# Altium schematic sheet AUDIO&ETHNET.SchDoc: Explorer STM32F407 Board
size A4; Author: ATOM@ALIENTEK; Revision: V3.4; SheetSize: A4
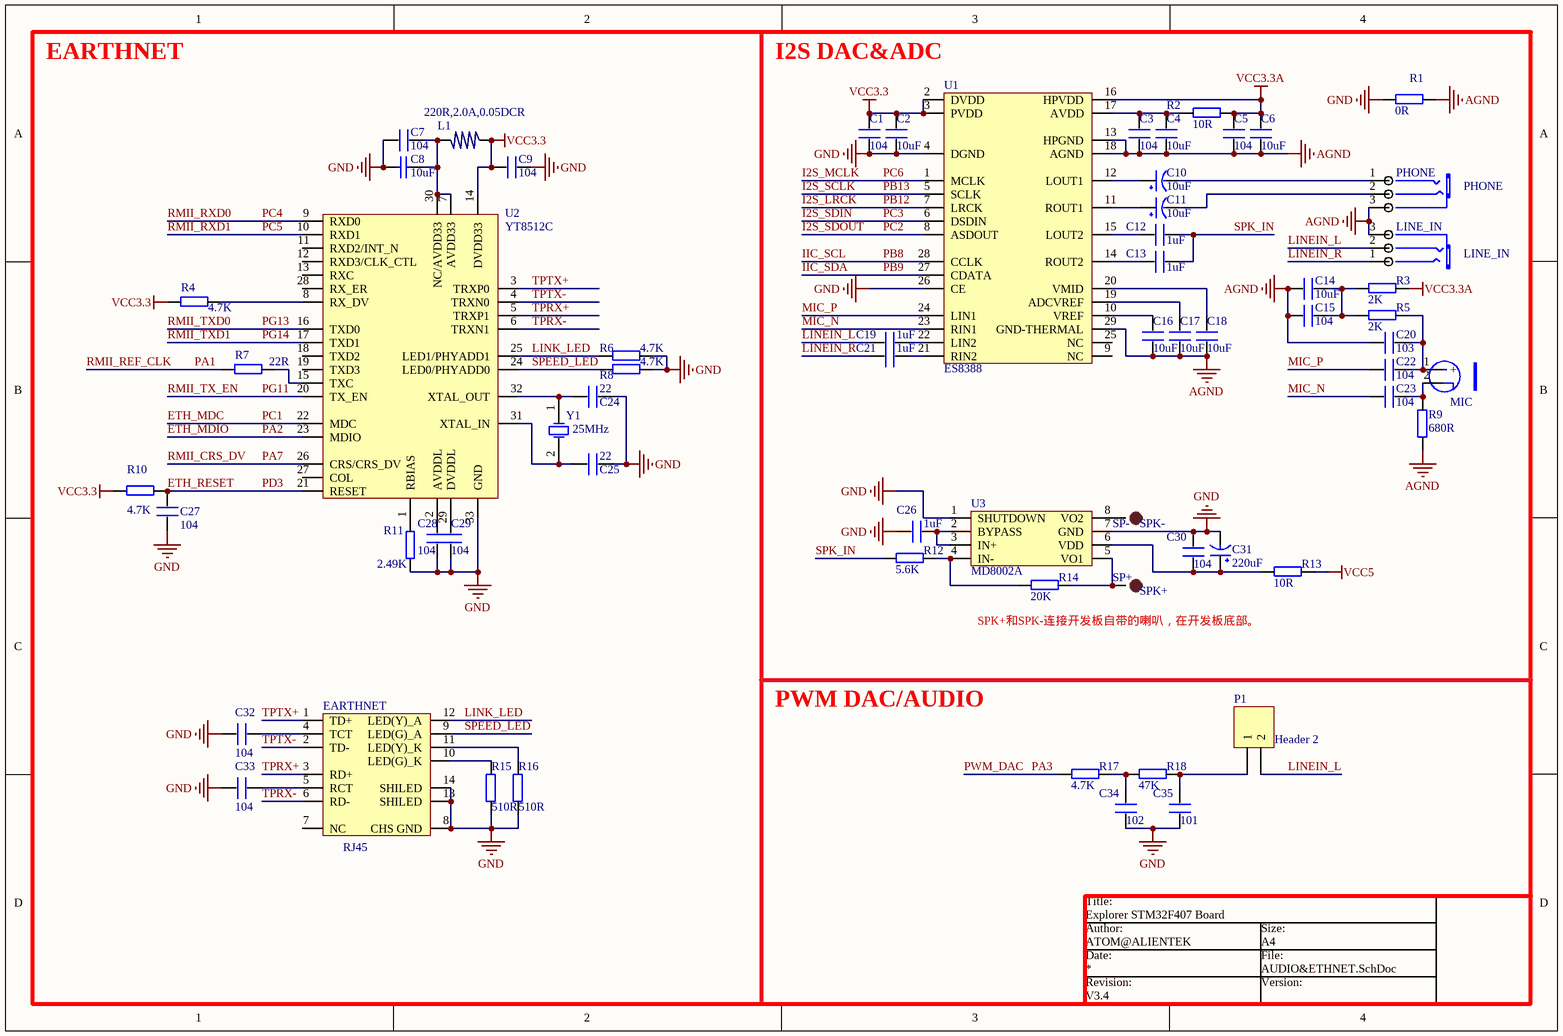
[diagram p0: AUDIO&ETHNET.SchDoc]

## Parts
C1  104  [0402]
C2  10uF  [0603P]
C3  104  [0402]
C4  10uF  [0603P]
C5  104  [0402]
C6  10uF  [0603P]
C7  104  [0402]
C8  10uF  [0603P]
C9  104  [0402]
C10  10uF  [0603P]
C11  10uF  [0603P]
C12  1uF  [0402]
C13  1uF  [0402]
C14  10uF  [0603P]
C15  104  [0402]
C16  10uF  [0603P]
C17  10uF  [0603P]
C18  10uF  [0603P]
C19  1uF  [0402]
C20  103  [0402]
C21  1uF  [0402]
C22  104  [0402]
C23  104  [0402]
C24  22  [0402]
C25  22  [0402]
C26  1uF  [0402]
C27  104  [0402]
C28  104  [0402]
C29  104  [0402]
C30  104  [0402]
C31  220uF  [CC6.56.5]
C32  104  [0402]
C33  104  [0402]
C34  102  [0402]
C35  101  [0402]
EARTHNET  RJ45  [HR911105A]
L1  220R,2.0A,0.05DCR  [0603P]
LINE_IN  LINE_IN  [PHONE_ST]
MIC1  MIC  [MIC-6022]
P1  Header 2  [HDR1X2]
PHONE  PHONE  [PHONE_ST]
R1  0R  [0402]
R2  10R  [0402]
R3  2K  [0402]
R4  4.7K  [0402]
R5  2K  [0402]
R6  4.7K  [0402]
R7  22R  [0402]
R8  4.7K  [0402]
R9  680R  [0402]
R10  4.7K  [0402]
R11  2.49K  [0402]
R12  5.6K  [0402]
R13  10R  [0402]
R14  20K  [0402]
R15  510R  [0402]
R16  510R  [0402]
R17  4.7K  [0402]
R18  47K  [0402]
SP+  SPK+  [TP-1.5]
SP-  SPK-  [TP-1.5]
U1  ES8388  [qfn28]
U2  YT8512C  [YT8512C]
U3  MD8002A  [SOP-8]
Y1  25MHz  [XTAL_US]

## Nets
AGND: C3.1 C4.1 C5.1 C6.1 C14.2 C15.1 C16.1 C17.1 C18.1 C20.2 LINE_IN.3(COM) PHONE.3(COM) R1.1 R9.2 U1.13(HPGND) U1.18(AGND) U1.29(GND-THERMAL)
GND: C1.1 C2.1 C7.1 C8.2 C9.1 C24.1 C25.1 C26.1 C27.1 C28.1 C29.1 C30.2 C31.2(GND) C32.1 C33.1 C34.1 C35.1 EARTHNET.8(CHS_GND) EARTHNET.13(SHILED) EARTHNET.14(SHILED) R1.2 R6.1 R8.1 R11.2 R15.2 R16.2 U1.4(DGND) U1.26(CE) U2.33(GND) U3.1(SHUTDOWN) U3.7(GND)
VCC3.3: C1.2 C2.2 C9.2 L1.1 R4.2 R10.2 U1.2(DVDD) U1.3(PVDD) U2.14(DVDD33)
VCC3.3A: C5.2 C6.2 R2.1 R3.1 U1.16(HPVDD)
VCC5: R13.1
ETH_MDC: U2.22(MDC)  [also labelled PC1]
ETH_MDIO: U2.23(MDIO)  [also labelled PA2]
ETH_RESET: C27.2 R10.1 U2.21(RESET)  [also labelled PD3]
I2S_LRCK: U1.7(LRCK)  [also labelled PB12]
I2S_MCLK: U1.1(MCLK)  [also labelled PC6]
I2S_SCLK: U1.5(SCLK)  [also labelled PB13]
I2S_SDIN: U1.6(DSDIN)  [also labelled PC3]
I2S_SDOUT: U1.8(ASDOUT)  [also labelled PC2]
IIC_SCL: U1.28(CCLK)  [also labelled PB8]
IIC_SDA: U1.27(CDATA)  [also labelled PB9]
LINEIN_L: C19.1 LINE_IN.2(CHR) P1.2
LINEIN_R: C21.1 LINE_IN.1(CHL)
LINK_LED: EARTHNET.12(LED(Y)_A) R6.2 U2.25(LED1/PHYADD1)
MIC_N: C23.2 U1.23(RIN1)
MIC_P: C22.2 U1.24(LIN1)
PA1: R7.2  [also labelled RMII_REF_CLK]
PA3: R17.2  [also labelled PWM_DAC]
PA7: U2.26(CRS/CRS_DV)  [also labelled RMII_CRS_DV]
PC4: U2.9(RXD0)  [also labelled RMII_RXD0]
PC5: U2.10(RXD1)  [also labelled RMII_RXD1]
PG11: U2.20(TX_EN)  [also labelled RMII_TX_EN]
PG13: U2.16(TXD0)  [also labelled RMII_TXD0]
PG14: U2.17(TXD1)  [also labelled RMII_TXD1]
SPEED_LED: EARTHNET.9(LED(G)_A) R8.2 U2.24(LED0/PHYADD0)
SPK_IN: C12.2 C13.2 R12.2
TPRX+: EARTHNET.3(RD+) U2.5(TRXP1)
TPRX-: EARTHNET.6(RD-) U2.6(TRXN1)
TPTX+: EARTHNET.1(TD+) U2.3(TRXP0)
TPTX-: EARTHNET.2(TD-) U2.4(TRXN0)
NetC3_2: C3.2 C4.2 R2.2 U1.17(AVDD)
NetC7_2: C7.2 C8.1 L1.2 U2.7(AVDD33) U2.30(NC/AVDD33)
NetC10_1: C10.1(VCC) U1.12(LOUT1)
NetC10_2: C10.2(GND) PHONE.1(CHL)
NetC11_1: C11.1(VCC) U1.11(ROUT1)
NetC11_2: C11.2(GND) PHONE.2(CHR)
NetC12_1: C12.1 U1.15(LOUT2)
NetC13_1: C13.1 U1.14(ROUT2)
NetC14_1: C14.1 C15.2 R3.2 R5.2
NetC16_2: C16.2 U1.10(VREF)
NetC17_2: C17.2 U1.19(ADCVREF)
NetC18_2: C18.2 U1.20(VMID)
NetC19_2: C19.2 U1.22(LIN2)
NetC20_1: C20.1 C22.1 MIC1.1(+) R5.1
NetC21_2: C21.2 U1.21(RIN2)
NetC23_1: C23.1 MIC1.2(GND) R9.1
NetC24_2: C24.2 U2.32(XTAL_OUT) Y1.1(OSC1)
NetC25_2: C25.2 U2.31(XTAL_IN) Y1.2(OSC2)
NetC26_2: C26.2 U3.2(BYPASS) U3.3(IN+)
NetC28_2: C28.2 U2.2(AVDDL)
NetC29_2: C29.2 U2.29(DVDDL)
NetC30_1: C30.1 C31.1(VCC) R13.2 U3.6(VDD)
NetC32_2: C32.2 EARTHNET.4(TCT)
NetC33_2: C33.2 EARTHNET.5(RCT)
NetC34_2: C34.2 R17.1 R18.2
NetC35_2: C35.2 P1.1 R18.1
NetEARTHNET_10: EARTHNET.10(LED(G)_K) R15.1
NetEARTHNET_11: EARTHNET.11(LED(Y)_K) R16.1
NetR4_1: R4.1 U2.8(RX_DV)
NetR7_1: R7.1 U2.15(TXC)
NetR11_1: R11.1 U2.1(RBIAS)
NetR12_1: R12.1 R14.2 U3.4(IN-)
NetR14_1: R14.1 SP+.1 U3.5(VO1)
NetSP-_1: SP-.1 U3.8(VO2)

Not connected (* = marked no-connect by the designer): EARTHNET 7(NC); U1 9(NC) 25(NC); U2 11(RXD2/INT_N) 12(RXD3/CLK_CTL) 13(RXC) 18(TXD2) 19(TXD3) 27(COL) 28(RX_ER)

## Notes on the sheet
- EARTHNET
- I2S DAC&ADC
- SPK+和SPK-连接开发板自带的喇叭，在开发板底部。
- PWM DAC/AUDIO
- Title:
- Author:
- Date:
- Revision:
- Size:
- File:
- Version:

## Library data of the parts
C1-C7 C9 C12-C30 C32-C35 = C
C8 = C-0603-SMD
C10 C11 C31 = CAP
EARTHNET = HR911105
L1 = L
LINE_IN PHONE = PHONE_M
MIC1 = MIC-6022
P1 = Header 2: Header, 2-Pin; LatestRevisionDate: 17-Jul-2002; LatestRevisionNote: Re-released for DXP Platform.; Publisher: Altium Limited
R1-R10 R12-R18 = R
R11 = R: 贴片电阻
SP+ SP- = TEST-POINT: 测试点
U1 = ES8388: 24bit ADC&DAC 96Khz
U2 = YT8512C: 10M/100M 网络PHY RMII/MII
U3 = MD8002A: 5V, 3W, 功放IC
Y1 = XTAL: Crystal Oscillator; Published: 8-Jun-2000; LatestRevisionDate: 17-Jul-2002; LatestRevisionNote: Re-released for DXP Platform.; Publisher: Altium Limited